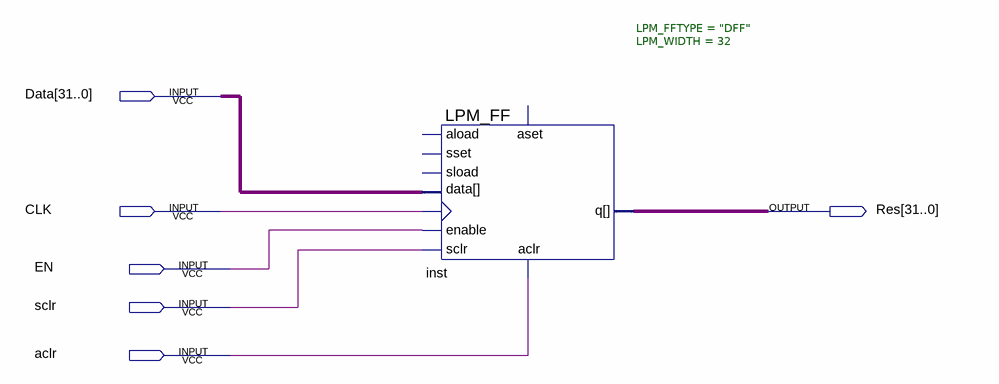
[diagram p0: schematic sheet]
// Quartus schematic PReg32.bdf as structural Verilog: 1 symbols, 6 pins
module PReg32 (
  input  [31:0] Data,
  input  CLK,
  input  EN,
  input  sclr,
  input  aclr,
  output [31:0] Res
);

  LPM_FF #(.LPM_FFTYPE("DFF"), .LPM_WIDTH(32)) inst (
    .enable(EN), .clock(CLK), .sclr(sclr), .aclr(aclr), .data(Data), .q(Res));  // open: aload, sset, sload, aset
endmodule
